# Altium project CAN Transceiver Test Board V1.PrjPcb
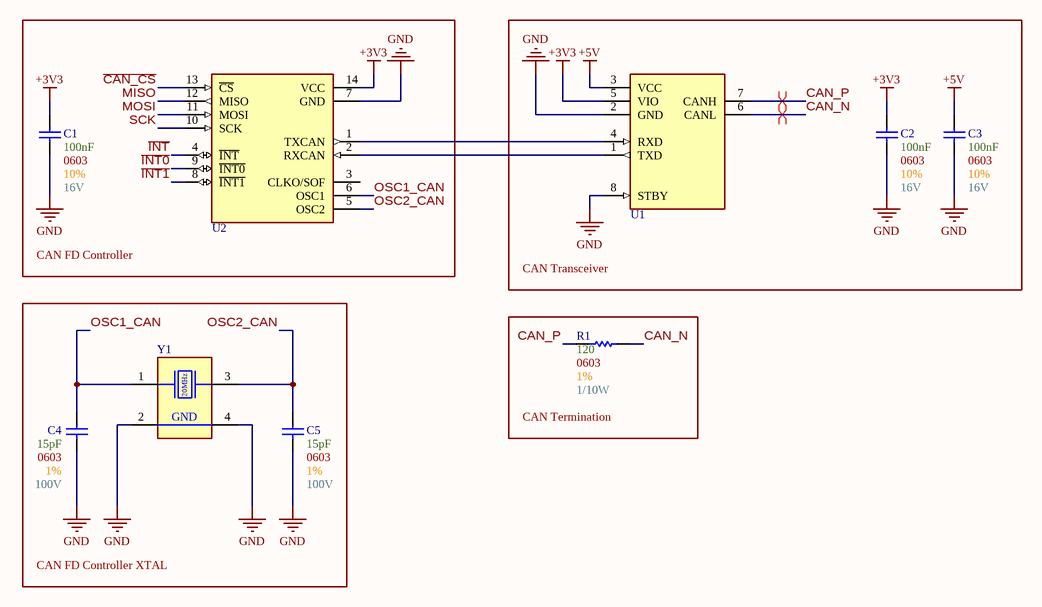
[diagram p0: CAN.SchDoc]
2 sheets, 12 parts. Net scope: global (net labels, ports and power ports of the same name join across sheets).
Board file: Main.PcbDoc
Sheets:
  CAN.SchDoc
  Connectors.SchDoc

## Sheet CAN.SchDoc
size A; SheetNumber: 1; SheetTotal: 2

### Parts
C1  Max Voltage: 16V  Size Package: 0603  Tolerance: 10%  Capacitance: 100nF  [[Cap] SMD 0603]  (hidden comment: [Cap] 0603 0.1uF 10% 16V)
C2  Max Voltage: 16V  Size Package: 0603  Tolerance: 10%  Capacitance: 100nF  [[Cap] SMD 0603]  (hidden comment: [Cap] 0603 0.1uF 10% 16V)
C3  Max Voltage: 16V  Size Package: 0603  Tolerance: 10%  Capacitance: 100nF  [[Cap] SMD 0603]  (hidden comment: [Cap] 0603 0.1uF 10% 16V)
C4  Max Voltage: 100V  Size Package: 0603  Tolerance: 1%  Capacitance: 15pF  [[Cap] SMD 0603]  (hidden comment: [Cap] 0603 15pF 1% 100V)
C5  Max Voltage: 100V  Size Package: 0603  Tolerance: 1%  Capacitance: 15pF  [[Cap] SMD 0603]  (hidden comment: [Cap] 0603 15pF 1% 100V)
R1  Wattage: 1/10W  Tolerance: 1%  Resistance: 120  Size Package: 0603  [[Res] SMD 0603]  (hidden comment: [120] SMD 0603 1% 1/10W)
U1  [CAN] Transceiver  [[CAN] Transceiver]  (value not drawn)
U2  [CAN] SPI-CAN FD Controller  [[CAN] SPI-CAN FD Controller]  (value not drawn)
Y1  [Crystal] SMD 20MHz  [[Crystal] SMD 20MHz]  (value not drawn)

### Blocks framed on the sheet
CAN FD Controller: C1 U2
CAN Transceiver: C2 C3 U1
CAN FD Controller XTAL: C4 C5 Y1
CAN Termination: R1

### Nets
+3V3: C1.2 C2.2 U1.5(VIO) U2.14(VCC)
+5V: C3.2 U1.3(VCC)
GND: C1.1 C2.1 C3.1 C4.1 C5.1 U1.2(GND) U1.8(STBY) U2.7(GND) Y1.2(GND) Y1.4(GND)
~{CAN_CS}: U2.13(~{CS})
~{INT}: U2.4(~{INT})
~{INT0}: U2.9(~{INT0})
~{INT1}: U2.8(~{INT1})
CAN_N: R1.1 U1.6(CANL)
CAN_P: R1.2 U1.7(CANH)
MISO: U2.12(MISO)
MOSI: U2.11(MOSI)
OSC1_CAN: C4.2 U2.6(OSC1) Y1.1(XTAL1)
OSC2_CAN: C5.2 U2.5(OSC2) Y1.3(XTAL2)
SCK: U2.10(SCK)
NetU1_1: U1.1(TXD) U2.2(RXCAN)
NetU1_4: U1.4(RXD) U2.1(TXCAN)

Not connected (* = marked no-connect by the designer): U2 3(CLKO/SOF)

### Layout directives
differential pair; differential pair class CAN_Pairs: CAN_N, CAN_P

### Notes on the sheet
- (in symbol [Crystal] SMD 20MHz) 20MHz

### Library data of the parts
C1-C3 = [Cap] 0603 0.1uF 10% 16V: CC0603KRX7R7BB104; Supplier 1: DigiKey; Supplier Part Number 1: 311-1088-6-ND
C4 C5 = [Cap] 0603 15pF 1% 100V: GCM1885C2A150FA16D; Supplier 1: DigiKey; Supplier Part Number 1: 490-16416-1-ND
R1 = [120] SMD 0603 1% 1/10W: RC0603FR-07120RL; Supplier 1: DigiKey; Supplier Part Number 1: 311-120HRCT-ND
U1 = [CAN] Transceiver: ATA6561-GAQW-N; Supplier 1: DigiKey; Supplier Part Number 1: ATA6561-GAQW-NCT-ND
U2 = [CAN] SPI-CAN FD Controller: MCP2518FDT-E/SL; Supplier 1: DigiKey; Supplier Part Number 1: MCP2518FDT-E/SLCT-ND
Y1 = [Crystal] SMD 20MHz: TSX-3225 20.0000MF20G-AC3; Supplier 1: DigiKey; Supplier Part Number 1: SER3629CT-ND

## Sheet Connectors.SchDoc
size A; SheetNumber: 2; SheetTotal: 2
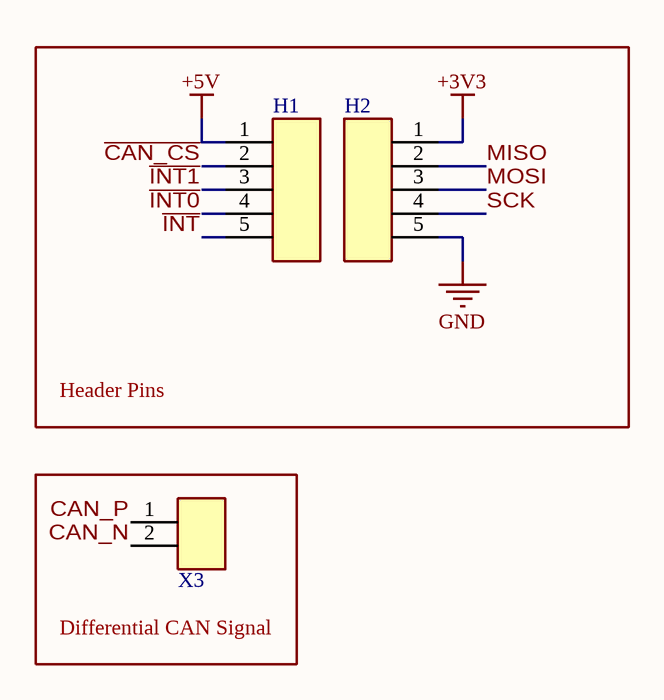
[diagram p1: Connectors.SchDoc]

### Parts
H1  1x5 Header  [[Header] 1x5 Male]  (value not drawn)
H2  1x5 Header  [[Header] 1x5 Male]  (value not drawn)
X3  2pin Screw Terminal  [[Screw Terminal] 2pin 5mm]  (value not drawn)

### Blocks framed on the sheet
Header Pins: H1 H2
Differential CAN Signal: X3

### Nets
+3V3: H2.1
+5V: H1.1
GND: H2.5
~{CAN_CS}: H1.2
~{INT}: H1.5
~{INT0}: H1.4
~{INT1}: H1.3
CAN_N: X3.2
CAN_P: X3.1
MISO: H2.2
MOSI: H2.3
SCK: H2.4

### Library data of the parts
H1 H2 = [Header] 1x5 Male: 2.54mm pitch
X3 = [Screw Terminal] 2pin: TB002-500-02BE; Supplier 1: DigiKey; Supplier Part Number 1: 102-6145-ND

## Nets that join several sheets
+3V3: CAN (C1.2 C2.2 U1.5 U2.14), Connectors (H2.1)
+5V: CAN (C3.2 U1.3), Connectors (H1.1)
GND: CAN (10 pins), Connectors (H2.5)
~{CAN_CS}: CAN (U2.13), Connectors (H1.2)
~{INT}: CAN (U2.4), Connectors (H1.5)
~{INT0}: CAN (U2.9), Connectors (H1.4)
~{INT1}: CAN (U2.8), Connectors (H1.3)
CAN_N: CAN (R1.1 U1.6), Connectors (X3.2)
CAN_P: CAN (R1.2 U1.7), Connectors (X3.1)
MISO: CAN (U2.12), Connectors (H2.2)
MOSI: CAN (U2.11), Connectors (H2.3)
SCK: CAN (U2.10), Connectors (H2.4)